# Altium schematic sheet 4_encoder.SchDoc
size A4; SheetNumber: 4; SheetTotal: 6
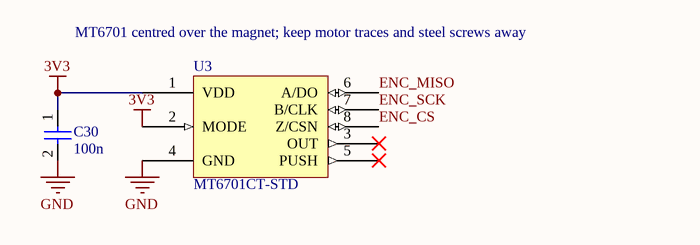
[diagram p0: 4_encoder.SchDoc]

## Parts
C30  100n  [RES_0603]
U3  MT6701CT-STD  [FP-D0008A-MFG]

## Nets
3V3: C30.1 U3.1(VDD) U3.2(MODE)
GND: C30.2 U3.4(GND)
ENC_CS: U3.8(Z/CSN)
ENC_MISO: U3.6(A/DO)
ENC_SCK: U3.7(B/CLK)

Not connected (* = marked no-connect by the designer): U3 3(OUT)* 5(PUSH)*

## Notes on the sheet
- (near U3) MT6701 centred over the magnet; keep motor traces and steel screws away

## Library data of the parts
C30 = CAP_0603: Capacitor, 0603; Value: 100n
U3 = MT6701CT-STD: Magnetic angle encoder, SOP-8